# EAGLE design control board (EAGLE 9.7.0)
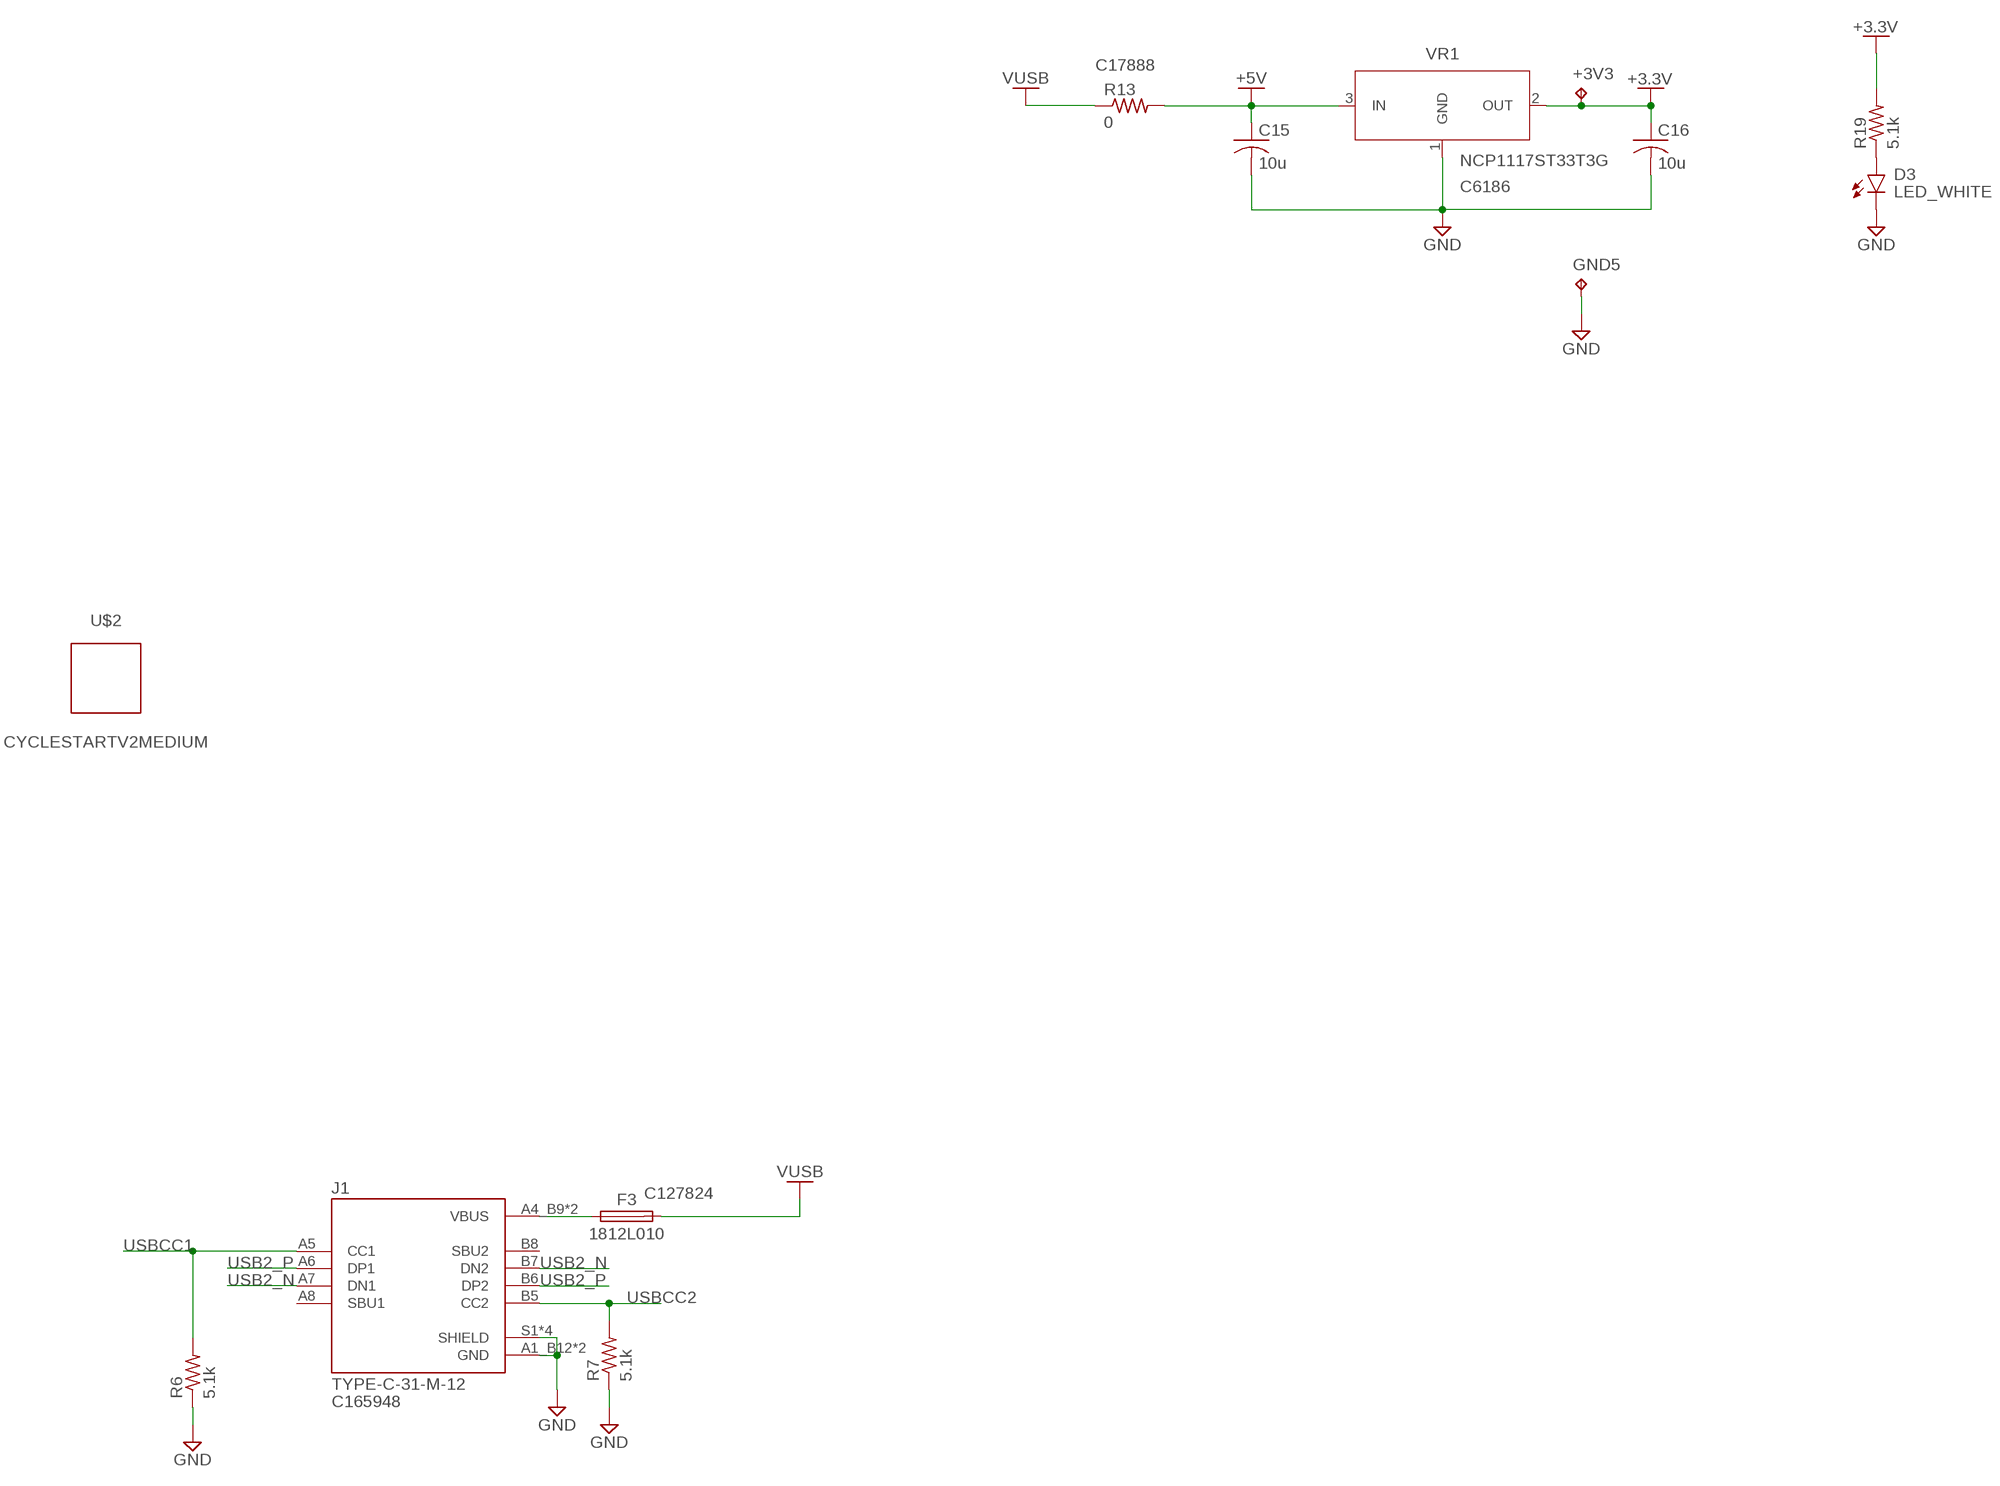
[diagram p0: schematic, sheet 1, part 1 of 2]
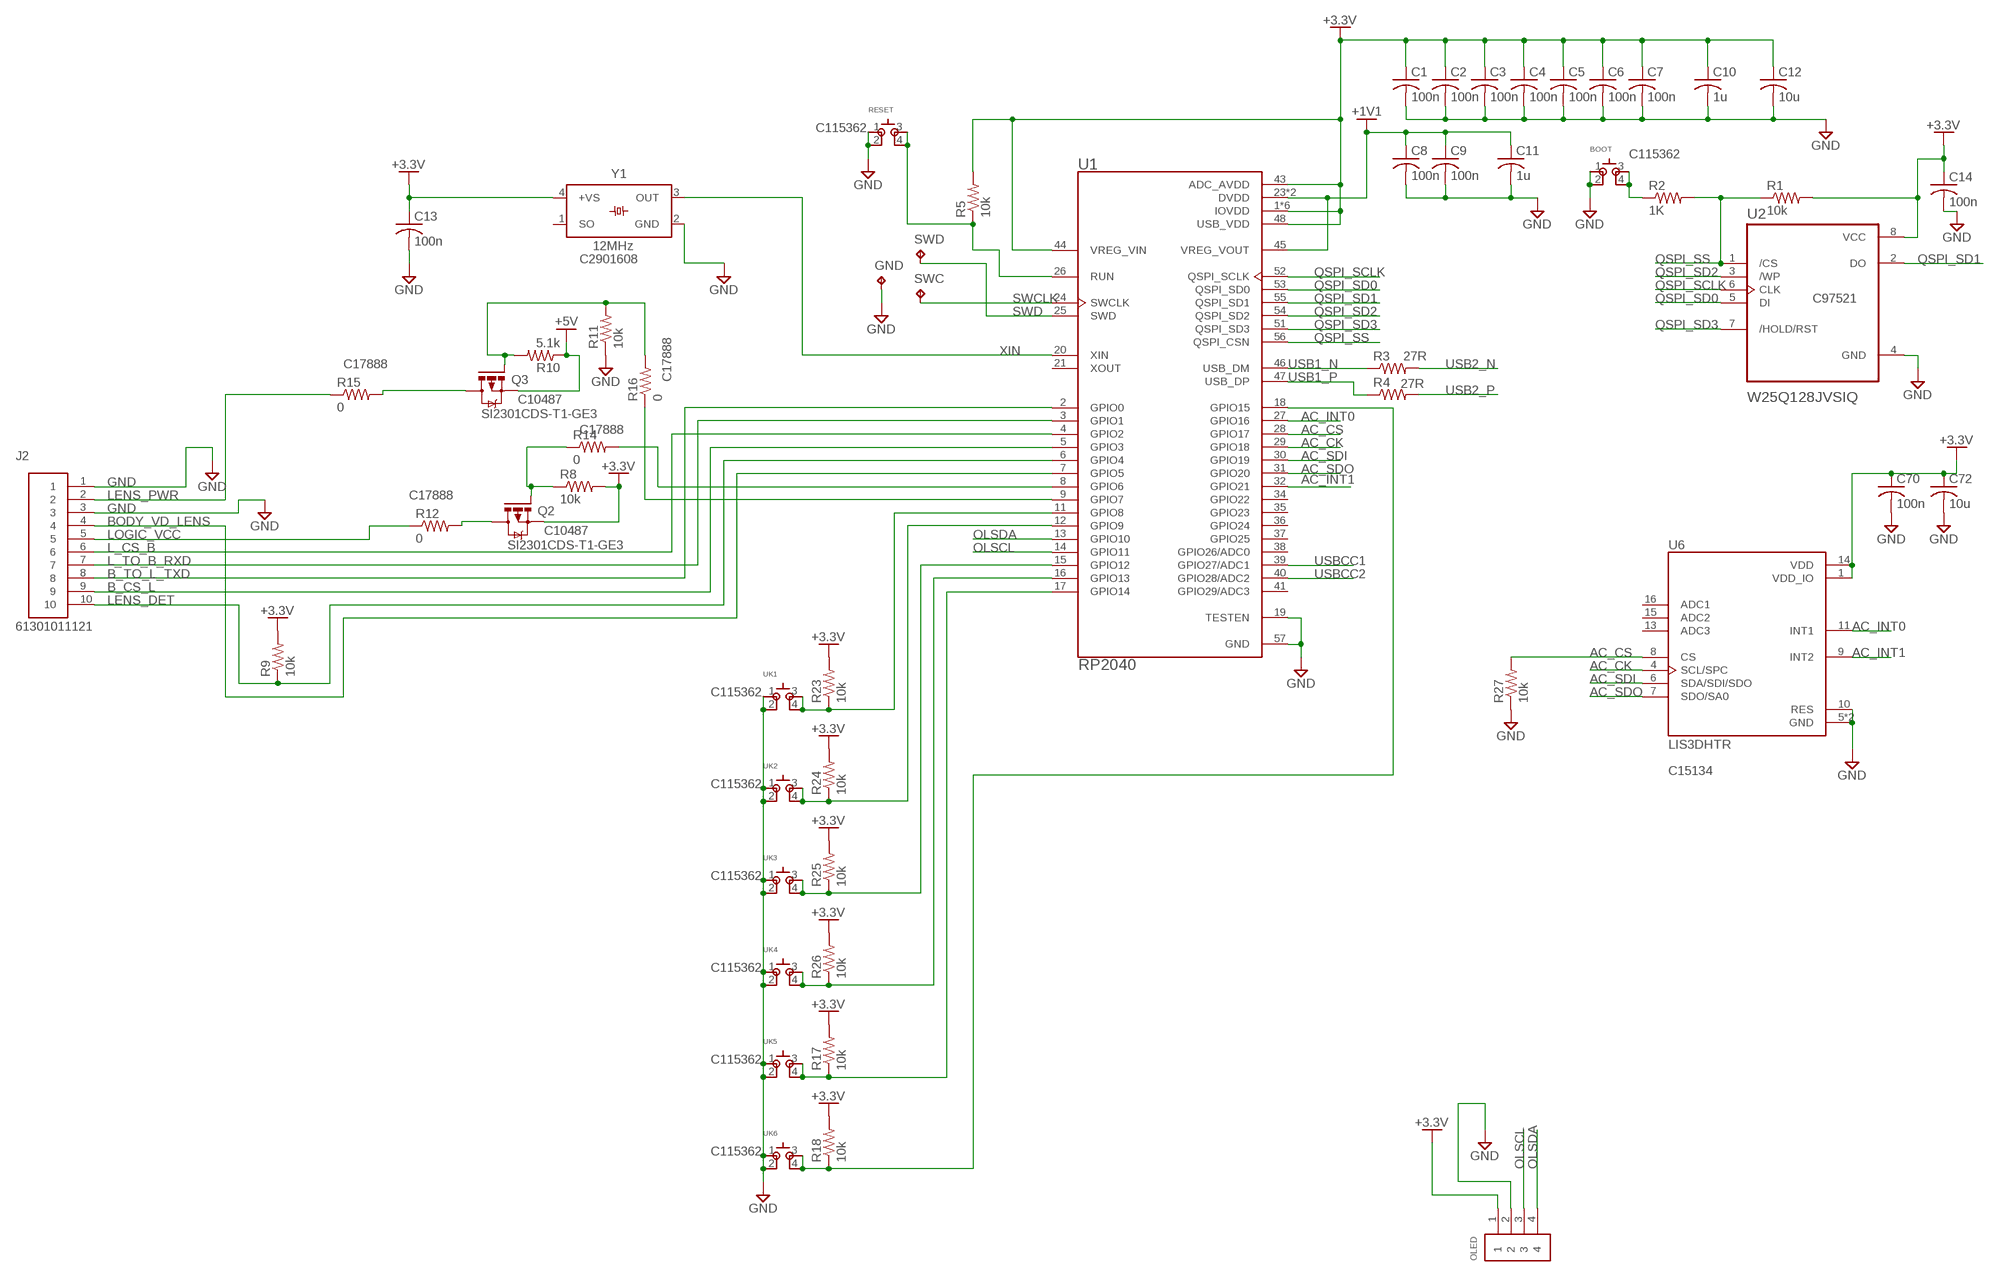
[diagram p1: schematic, sheet 1, part 2 of 2]

## Parts
+3V3  TPB2,54  [B2,54]
BOOT  SKSCLDE010  [SKSCLDE010]
C1  100n  C-USC0603  [C0603]
C2  100n  C-USC0603  [C0603]
C3  100n  C-USC0603  [C0603]
C4  100n  C-USC0603  [C0603]
C5  100n  C-USC0603  [C0603]
C6  100n  C-USC0603  [C0603]
C7  100n  C-USC0603  [C0603]
C8  100n  C-USC0603  [C0603]
C9  100n  C-USC0603  [C0603]
C10  1u  C-USC0603  [C0603]
C11  1u  C-USC0603  [C0603]
C12  10u  C-USC0603  [C0603]
C13  100n  C-USC0603  [C0603]
C14  100n  C-USC0603  [C0603]
C15  10u  C-USC0603  [C0603]
C16  10u  C-USC0603  [C0603]
C70  100n  C-USC0603  [C0603]
C72  10u  C-USC0603  [C0603]
D3  LED_WHITE  CHIP-FLAT-B_0603-0.35MM  [LEDC1608X35N_FLAT-B]
F3  1812L010  [FUSC4532X125]
GND  TPB2,54  [B2,54]
GND5  TPB2,54  [B2,54]
J1  TYPE-C-31-M-12  [HRO_TYPE-C-31-M-12]
J2  61301011121  [61301011121]
OLED  61300411121  [61300411121]
Q2  SI2301CDS-T1-GE3  PMOSFET_IRLML5203_SOT23-GSD  [SOT23]
Q3  SI2301CDS-T1-GE3  PMOSFET_IRLML5203_SOT23-GSD  [SOT23]
R1  10k  R-US_R0603  [R0603]
R2  1K  R-US_R0603  [R0603]
R3  27R  R-US_R0603  [R0603]
R4  27R  R-US_R0603  [R0603]
R5  10k  R-US_R0603  [R0603]
R6  5.1k  R-US_R0603  [R0603]
R7  5.1k  R-US_R0603  [R0603]
R8  10k  R-US_R0603  [R0603]
R9  10k  R-US_R0603  [R0603]
R10  5.1k  R-US_R0603  [R0603]
R11  10k  R-US_R0603  [R0603]
R12  0  R-US_R1206  [R1206]
R13  0  R-US_R1206  [R1206]
R14  0  R-US_R1206  [R1206]
R15  0  R-US_R1206  [R1206]
R16  0  R-US_R1206  [R1206]
R17  10k  R-US_R0603  [R0603]
R18  10k  R-US_R0603  [R0603]
R19  5.1k  R-US_R0603  [R0603]
R23  10k  R-US_R0603  [R0603]
R24  10k  R-US_R0603  [R0603]
R25  10k  R-US_R0603  [R0603]
R26  10k  R-US_R0603  [R0603]
R27  10k  R-US_R0603  [R0603]
RESET  SKSCLDE010  [SKSCLDE010]
SWC  TPB2,54  [B2,54]
SWD  TPB2,54  [B2,54]
U1  RP2040  [QFN40P700X700X90-57N]
U2  W25Q128JVSIQ  W25Q64JVSSIQ  [SOIC127P790X216-8N]
U6  LIS3DHTR  [XDCR_LIS3DHTR]
U$2  CYCLESTARTV2MEDIUM  [CYCLESTARTV2MEDIUM]
UK1  SKSCLDE010  [SKSCLDE010]
UK2  SKSCLDE010  [SKSCLDE010]
UK3  SKSCLDE010  [SKSCLDE010]
UK4  SKSCLDE010  [SKSCLDE010]
UK5  SKSCLDE010  [SKSCLDE010]
UK6  SKSCLDE010  [SKSCLDE010]
VR1  NCP1117ST33T3G  NCP1117ST33T3GSOT-223  [SOT230P700X170-4]
Y1  12MHz  WE-SPXO_IQXO-540_830208214609  [WE-SPXO_IQXO-540]

## Nets
+1V1: C8.1 C9.1 C11.1 U1.23(DVDD) U1.45(VREG_VOUT) U1.50(DVDD)
+3.3V: +3V3.TP C1.1 C2.1 C3.1 C4.1 C5.1 C6.1 C7.1 C10.1 C12.1 C13.1 C14.1 C16.1 C70.1 C72.1 OLED.1 Q2.2(S) R1.2 R5.2 R8.2 R9.2 R17.2 R18.2 R19.2 R23.2 R24.2 R25.2 R26.2 U1.1(IOVDD) U1.10(IOVDD) U1.22(IOVDD) U1.33(IOVDD) U1.42(IOVDD) U1.43(ADC_AVDD) U1.44(VREG_VIN) U1.48(USB_VDD) U1.49(IOVDD) U2.8(VCC) U6.1(VDD_IO) U6.14(VDD) VR1.2(OUT) Y1.4(+VS)
+5V: C15.1 Q3.2(S) R10.1 R13.2 VR1.3(IN)
AC_CK: U1.29(GPIO18) U6.4(SCL/SPC)
AC_CS: R27.2 U1.28(GPIO17) U6.8(CS)
AC_INT0: U1.27(GPIO16) U6.11(INT1)
AC_INT1: U1.32(GPIO21) U6.9(INT2)
AC_SDI: U1.30(GPIO19) U6.6(SDA/SDI/SDO)
AC_SDO: U1.31(GPIO20) U6.7(SDO/SA0)
B_CS_L: J2.9 U1.5(GPIO3)
B_TO_L_TXD: J2.8 U1.2(GPIO0)
BODY_VD_LENS: J2.4 U1.7(GPIO5)
GND: BOOT.1 BOOT.2 C1.2 C2.2 C3.2 C4.2 C5.2 C6.2 C7.2 C8.2 C9.2 C10.2 C11.2 C12.2 C13.2 C14.2 C15.2 C16.2 C70.2 C72.2 D3.C GND5.TP GND.TP J1.A1_B12(GND) J1.B1_A12(GND) J1.S1(SHIELD) J1.S2(SHIELD) J1.S3(SHIELD) J1.S4(SHIELD) J2.1 J2.3 OLED.2 R6.1 R7.1 R11.1 R27.1 RESET.1 RESET.2 U1.19(TESTEN) U1.57(GND) U2.4(GND) U6.5(GND) U6.10(RES) U6.12(GND) UK1.1 UK1.2 UK2.1 UK2.2 UK3.1 UK3.2 UK4.1 UK4.2 UK5.1 UK5.2 UK6.1 UK6.2 VR1.1(GND) Y1.2(GND)
L_CS_B: J2.6 U1.4(GPIO2)
L_TO_B_RXD: J2.7 U1.3(GPIO1)
LENS_DET: J2.10 R9.1 U1.6(GPIO4)
LENS_PWR: J2.2 R15.1
LOGIC_VCC: J2.5 R12.1
N$1: D3.A R19.1
N$2: R14.2 U1.8(GPIO6)
N$3: BOOT.3 BOOT.4 R2.1
N$4: R16.1 U1.9(GPIO7)
N$5: R5.1 RESET.3 RESET.4 U1.26(RUN)
N$6: Q2.3(D) R12.2
N$7: Q2.1(G) R8.1 R14.1
N$8: Q3.3(D) R15.2
N$9: Q3.1(G) R10.2 R11.2 R16.2
N$10: R17.1 U1.17(GPIO14) UK5.3 UK5.4
N$11: R18.1 U1.18(GPIO15) UK6.3 UK6.4
N$17: F3.1 J1.A4_B9(VBUS) J1.B4_A9(VBUS)
N$20: R23.1 U1.11(GPIO8) UK1.3 UK1.4
N$108: R24.1 U1.12(GPIO9) UK2.3 UK2.4
N$109: R25.1 U1.15(GPIO12) UK3.3 UK3.4
N$110: R26.1 U1.16(GPIO13) UK4.3 UK4.4
OLSCL: OLED.3 U1.14(GPIO11)
OLSDA: OLED.4 U1.13(GPIO10)
QSPI_SCLK: U1.52(QSPI_SCLK) U2.6(CLK)
QSPI_SD0: U1.53(QSPI_SD0) U2.5(DI)
QSPI_SD1: U1.55(QSPI_SD1) U2.2(DO)
QSPI_SD2: U1.54(QSPI_SD2) U2.3(/WP)
QSPI_SD3: U1.51(QSPI_SD3) U2.7(/HOLD/RST)
QSPI_SS: R1.1 R2.2 U1.56(QSPI_CSN) U2.1(/CS)
SWCLK: SWC.TP U1.24(SWCLK)
SWD: SWD.TP U1.25(SWD)
USB1_N: R3.1 U1.46(USB_DM)
USB1_P: R4.1 U1.47(USB_DP)
USB2_N: J1.A7(DN1) J1.B7(DN2) R3.2
USB2_P: J1.A6(DP1) J1.B6(DP2) R4.2
USBCC1: J1.A5(CC1) R6.2 U1.39(GPIO27/ADC1)
USBCC2: J1.B5(CC2) R7.2 U1.40(GPIO28/ADC2)
VUSB: F3.2 R13.1
XIN: U1.20(XIN) Y1.3(OUT)
Unconnected: J1.A8(SBU1) J1.B8(SBU2) U1.21(XOUT) U1.34(GPIO22) U1.35(GPIO23) U1.36(GPIO24) U1.37(GPIO25) U1.38(GPIO26/ADC0) U1.41(GPIO29/ADC3) U6.13(ADC3) U6.15(ADC2) U6.16(ADC1) Y1.1(SO)

## Library data of the parts
+3V3 GND GND5 SWC SWD = testpad:TP: Test pad
BOOT RESET UK1-UK6 = alps:SKSCLDE010; JLCPN: C115362
C1-C9 C13 C14 C70 = rcl:C-US: CAPACITOR, American symbol; JLCPN: C14663
C10 C11 = rcl:C-US: CAPACITOR, American symbol; JLCPN: C15849
C12 C15 C16 C72 = rcl:C-US: CAPACITOR, American symbol; JLCPN: C19702
D3 = LED:CHIP-FLAT-B; JLCPN: C2290
F3 = Fuse:1812L: 1812L Series PTC provides surface mount overcurrent protection for applications where resettable protection is desired. Datasheet <https://www.littelfuse.com/~/media/electronics/datasheets/resettable_ptcs/littelfuse_ptc_1812l_datasheet.pdf.pdf>; JLCPN: C127824
J1 = SnapEDA Library:TYPE-C-31-M-12; JLCPN: C165948
J2 = Headers:61301011121: CONN HEADER VERT 10POS 2.54MM Manufacturer's datasheet <https://katalog.we-online.de/em/datasheet/6130xx11121.pdf>
OLED = Headers:61300411121: CONN HEADER VERT 4POS 2.54MM Manufacturer's datasheet <https://katalog.we-online.de/em/datasheet/6130xx11121.pdf>
Q2 Q3 = Transistor:PMOSFET_: P-Channel MOSFET - Popular parts; JLCPN: C10487
R1 R5 R8 R9 R11 R17 R18 R23-R27 = rcl:R-US_: RESISTOR, American symbol; JLCPN: C25804
R2 = rcl:R-US_: RESISTOR, American symbol; JLCPN: C21190
R3 R4 = rcl:R-US_: RESISTOR, American symbol; JLCPN: C2907021
R6 R7 R10 R19 = rcl:R-US_: RESISTOR, American symbol; JLCPN: C23186
R12-R16 = rcl:R-US_: RESISTOR, American symbol; JLCPN: C17888
U1 = SnapEDA Library:RP2040; JLCPN: C2040
U2 = SnapEDA Library:W25Q64JVSSIQ: None; JLCPN: C97521
U6 = LIS3DHTR:LIS3DHTR: MEMS digital output motion sensor ultra low-power high performance 3-axes "nano" accelerometer Check availability <https://pricing.snapeda.com/parts/LIS3DHTR/STMicroelectronics/view-part?ref=eda>; JLCPN: C15134
U$2 = Logos:CYCLESTARTV2
VR1 = IC_Power-Management:NCP1117ST33T3G: 1.0 A Low-Dropout Positive Fixed and Adjustable Voltage Regulators Datasheet <https://www.onsemi.com/pub/Collateral/NCP1117-D.PDF>; JLCPN: C6186
Y1 = Wurth_Quartz Crystals & Oscillators_WE-SPXO:WE-SPXO_IQXO-540: WE-SPXO Simple Packaged Quartz Oscillator Characteristics SMT models Hermetically sealed Frequencies between 3.6864 MHz and 125 MHz Maximum operating temperatures range:-40 °C to 85 °C Stabilities down to ± 25 ppm available Available supply voltages: 1.8 V, 3.3 V and 5 V Available output signal types: CMOS; HCMOS; HCMOS/TTL Applications Microprocessor Wireless Communication Devices Industrial Devices Real Time Clocks Wired Communication (e.g. Ethernet and USB) IoT Optical Network Audio and Multimedia Devices Test and Measurement Equipment Navigation and Locators <https://www.we-online.com/catalog/media/o135918v209%20Family_WE-SPXO.jpg> Details see: https://www.we-online.com/catalog/en/WE-SPXO Updated by Ella Wu, 2019-09-03 2019 (C) Wurth Elektronik; JLCPN: C2901608

## Board
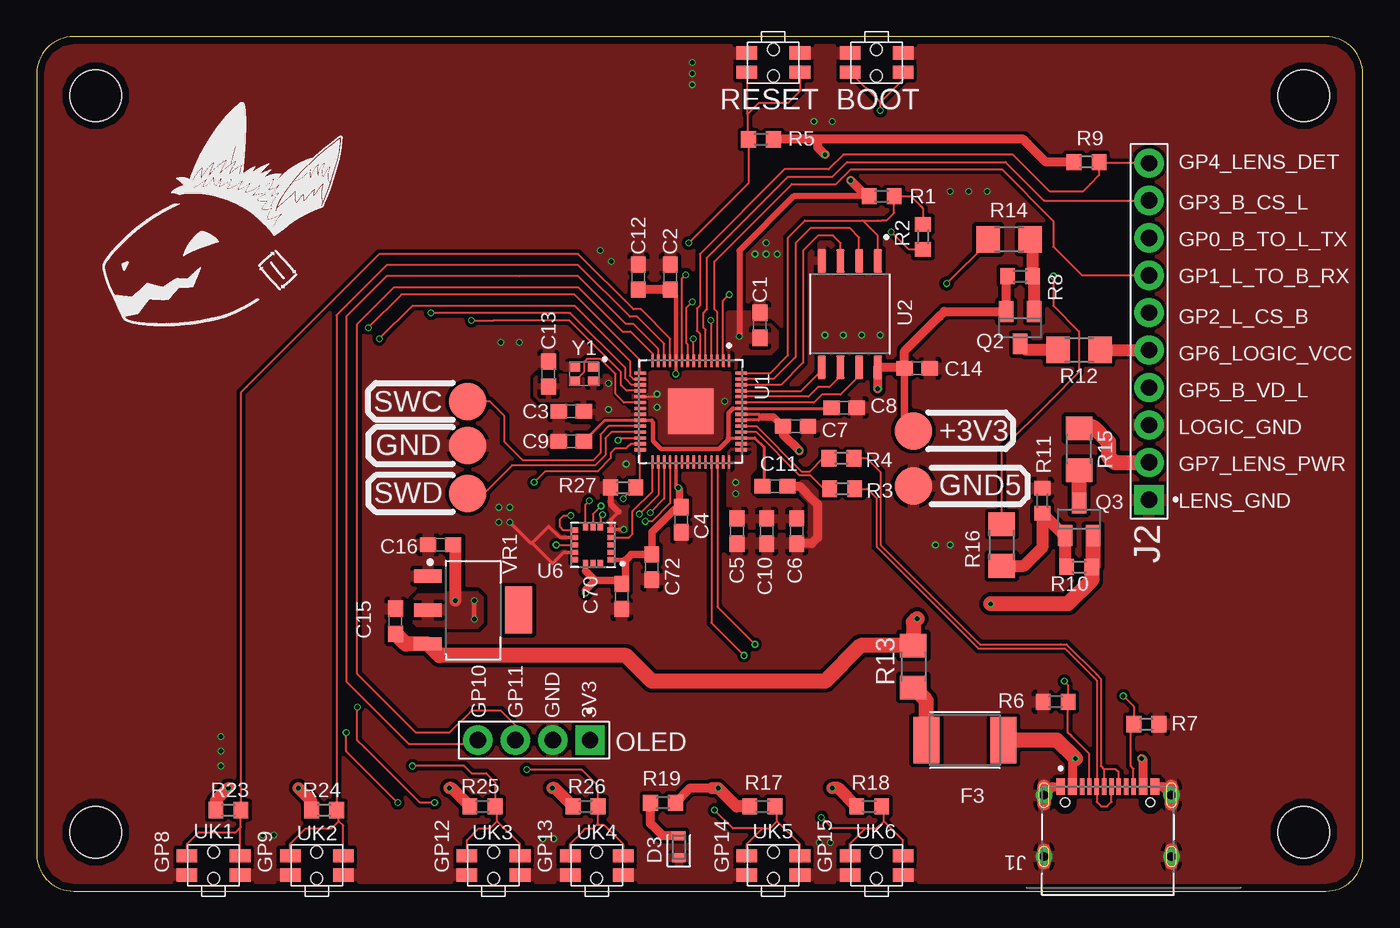
[diagram p2: board, top side]
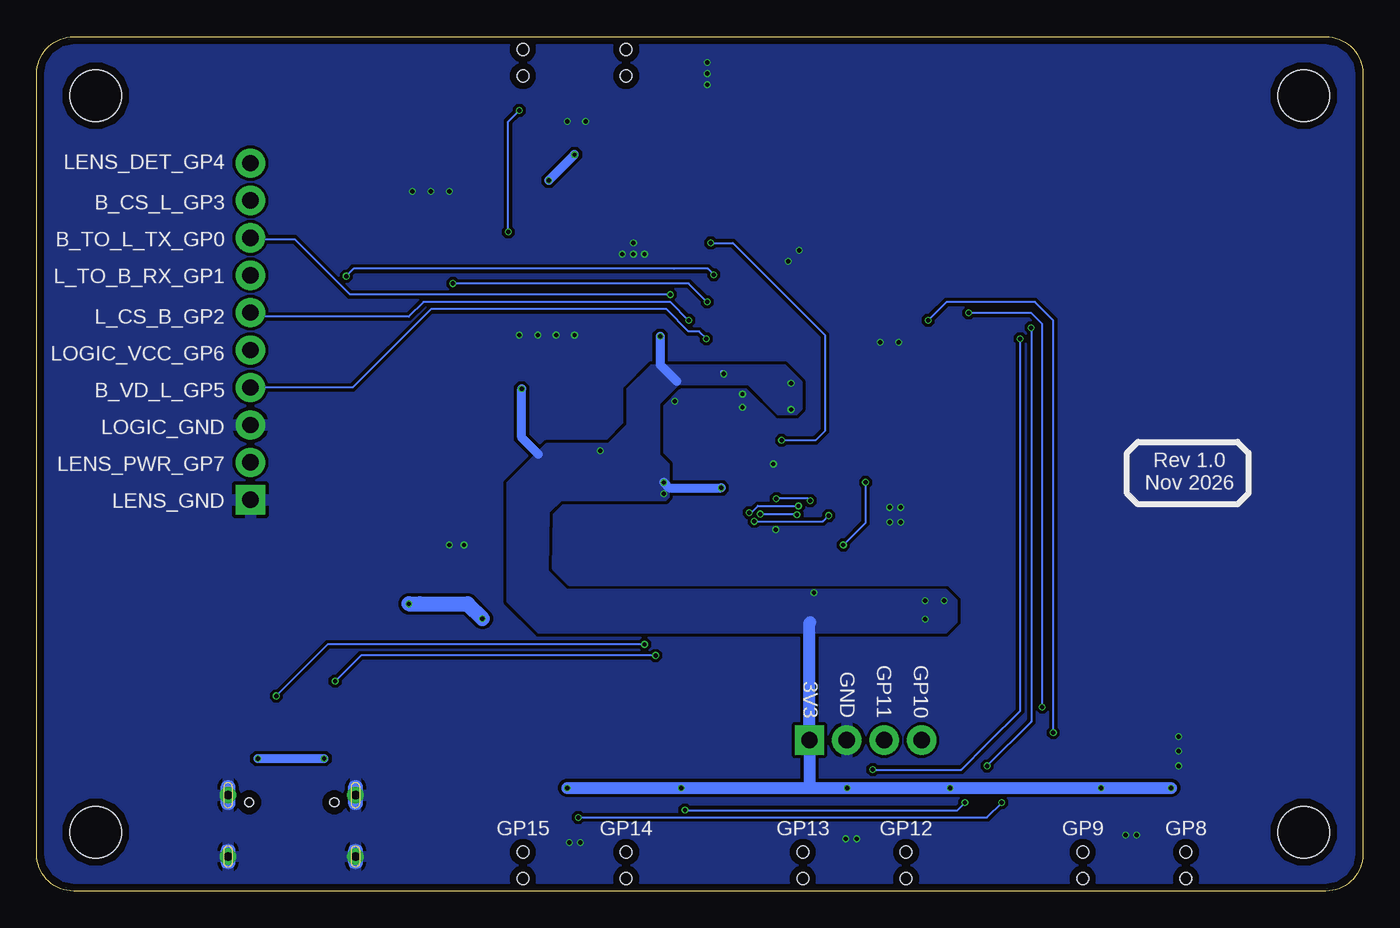
[diagram p3: board, bottom side, seen from below]

Size 90 x 58 mm. Coordinates in mm from the lower left corner, seen from the top.
Outline: 12.5,58 2.5,58 arc90 0,55.5 0,2.5 arc90 2.5,0 87.5,0 arc90 90,2.5 90,55.25 90,55.5 arc90 87.5,58 12.5,58
Copper layers (1*16): Top / Bottom
Stack-up 2 Layer Stack: Top SilkScreen Epoxy Ink / Top SolderMask SR:Black 0.0254mm Dk 4 / Top Surface Finish Lead-Free 0.02mm / Top CuFoil:007 0.035mm / Dielectric-1 Core:080 0.711mm / Bottom CuFoil:007 0.035mm / Bottom Surface Finish Lead-Free 0.02mm / Bottom SolderMask SR:Black 0.0254mm Dk 4 / Bottom SilkScreen Epoxy Ink
Design rules: minimum copper width 5mil, minimum drill size 0.3mm, copper clearance wire_polygon to wire_polygon 5mil, copper clearance wire_polygon to pad_smd 5mil, copper clearance wire_polygon to via 5mil, copper clearance pad_smd to pad_smd 5mil, copper clearance pad_smd to via 5mil, copper clearance via to via 5mil, copper clearance smd to pad (same net) 5mil, copper clearance smd to via (same net) 5mil, copper clearance smd to smd (same net) 5mil, dimension clearance 0.2mm, via restrict clearance 0mil, restrict clearance 0mil, drill distance 6mil, keepout clearance 0mil
Holes 3.5 mm at 4,4 86,4 86,54 4,54

### Footprints (pad centres in the part's own frame; a part is rotated, then mirrored left to right if it is on the bottom)
B2,54 = smd 2.54 x 2.54: TP 0,0
SKSCLDE010 = smd 1.4 x 0.9: 1 -1.8,-0.65; 2 1.8,-0.65; 3 -1.8,0.65; 4 1.8,0.65 | hole 0.8: 0,0.9; 0,-0.9
C0603 = smd 1.1 x 1: 1 -0.85,0; 2 0.85,0
LEDC1608X35N_FLAT-B = smd 0.612 x 0.912: A 0.75,0; C -0.75,0
FUSC4532X125 = smd 1.78 x 3.15: 1 -2.615,0; 2 2.615,0
HRO_TYPE-C-31-M-12 = smd 0.6 x 1.14: A1_B12 -3.2,4.75; A4_B9 -2.4,4.75; B1_A12 3.2,4.75; B4_A9 2.4,4.75 | smd 0.3 x 1.14: A5 -1.25,4.75; A6 -0.25,4.75; A7 0.25,4.75; A8 1.25,4.75; B5 1.75,4.75; B6 0.75,4.75; B7 -0.75,4.75; B8 -1.75,4.75 | drill 0.6 pad 0.9: S1 -4.325,4.17; S2 4.325,4.17; S3 -4.325,0; S4 4.325,0 | hole 0.6: -2.89,3.68; 2.89,3.68
61301011121 = drill 1.1 square: 1 -11.43,0 | drill 1.1: 2 -8.89,0; 3 -6.35,0; 4 -3.81,0; 5 -1.27,0; 6 1.27,0; 7 3.81,0; 8 6.35,0; 9 8.89,0; 10 11.43,0
61300411121 = drill 1.1 square: 1 -3.81,0 | drill 1.1: 2 -1.27,0; 3 1.27,0; 4 3.81,0
SOT23 = smd 1 x 1.4: 1 -0.95,-1.1; 2 0.95,-1.1; 3 0,1.1
R0603 = smd 1 x 1.1: 1 -0.85,0; 2 0.85,0
R1206 = smd 1.6 x 1.803: 1 -1.422,0; 2 1.422,0
QFN40P700X700X90-57N = smd 0.84 x 0.2: 1 -3.435,2.6; 2 -3.435,2.2; 3 -3.435,1.8; 4 -3.435,1.4; 5 -3.435,1; 6 -3.435,0.6; 7 -3.435,0.2; 8 -3.435,-0.2; 9 -3.435,-0.6; 10 -3.435,-1; 11 -3.435,-1.4; 12 -3.435,-1.8; 13 -3.435,-2.2; 14 -3.435,-2.6; 29 3.435,-2.6; 30 3.435,-2.2; 31 3.435,-1.8; 32 3.435,-1.4; 33 3.435,-1; 34 3.435,-0.6; 35 3.435,-0.2; 36 3.435,0.2; 37 3.435,0.6; 38 3.435,1; 39 3.435,1.4; 40 3.435,1.8; 41 3.435,2.2; 42 3.435,2.6 | smd 0.2 x 0.84: 15 -2.6,-3.435; 16 -2.2,-3.435; 17 -1.8,-3.435; 18 -1.4,-3.435; 19 -1,-3.435; 20 -0.6,-3.435; 21 -0.2,-3.435; 22 0.2,-3.435; 23 0.6,-3.435; 24 1,-3.435; 25 1.4,-3.435; 26 1.8,-3.435; 27 2.2,-3.435; 28 2.6,-3.435; 43 2.6,3.435; 44 2.2,3.435; 45 1.8,3.435; 46 1.4,3.435; 47 1,3.435; 48 0.6,3.435; 49 0.2,3.435; 50 -0.2,3.435; 51 -0.6,3.435; 52 -1,3.435; 53 -1.4,3.435; 54 -1.8,3.435; 55 -2.2,3.435; 56 -2.6,3.435 | smd 3.1 x 3.1: 57 0,0
SOIC127P790X216-8N = smd 1.61 x 0.58: 1 -3.605,1.905; 2 -3.605,0.635; 3 -3.605,-0.635; 4 -3.605,-1.905; 5 3.605,-1.905; 6 3.605,-0.635; 7 3.605,0.635; 8 3.605,1.905
XDCR_LIS3DHTR = smd 0.45 x 0.35: 1 -1.225,1; 2 -1.225,0.5; 3 -1.225,0; 4 -1.225,-0.5; 5 -1.225,-1; 9 1.225,-1; 10 1.225,-0.5; 11 1.225,0; 12 1.225,0.5; 13 1.225,1 | smd 0.35 x 0.45: 6 -0.5,-1.225; 7 0,-1.225; 8 0.5,-1.225; 14 0.5,1.225; 15 0,1.225; 16 -0.5,1.225
SOT230P700X170-4 = smd 1.86 x 0.898: 1 -3.075,2.3; 2 -3.075,0; 3 -3.075,-2.3 | smd 1.86 x 3.189: 4 3.075,0
WE-SPXO_IQXO-540 = smd 0.75 x 0.65: 1 -0.65,-0.5; 2 0.65,-0.5; 3 0.65,0.5; 4 -0.65,0.5

### Placement (x,y rotation side)
+3V3  59.5,31.25 0 top
BOOT  57,56.25 180 top
C1  49.09,38.41 90 top
C2  42.99,41.69 90 top
C3  36.27,32.57 180 top
C4  43.75,25.22 270 top
C5  47.52,24.44 270 top
C6  51.58,24.44 270 top
C7  51.5,31.55 0 top
C8  54.8,32.82 0 top
C9  36.27,30.54 180 top
C10  49.55,24.44 270 top
C11  50.11,27.49 0 top
C12  40.84,41.69 90 top
C13  34.74,35.11 90 top
C14  59.76,35.49 0 top
C15  24.36,18.32 90 top
C16  27.4,23.52 180 top
C70  39.7,20 270 top
C72  41.75,22 270 top
D3  43.58,3 90 top
F3  63,10.25 180 top
GND  29.25,30.25 0 top
GND5  59.5,27.5 0 top
J1  72.69,2.35 0 top
J2  75.5,38 90 top
OLED  33.75,10.25 180 top
Q2  66.75,38.25 180 top
Q3  70.75,25.25 0 top
R1  57.34,47.17 180 top
R2  60.15,44.41 90 top
R3  54.67,27.31 0 top
R4  54.62,29.39 0 top
R5  49.16,51.04 0 top
R6  69.15,12.85 0 top
R7  75.32,11.33 180 top
R8  66.75,41.75 180 top
R9  71.25,49.5 180 top
R10  70.75,22 180 top
R11  68.25,26.5 270 top
R12  70.75,36.75 180 top
R13  59.5,15.25 90 top
R14  66,44.25 180 top
R15  70.75,30 270 top
R16  65.5,23.5 270 top
R17  49.25,5.75 180 top
R18  56.5,5.75 180 top
R19  42.5,6 0 top
R23  13,5.5 180 top
R24  19.5,5.5 180 top
R25  30.25,5.75 180 top
R26  37.25,5.75 180 top
R27  39.8,27.4 0 top
RESET  50,56.25 180 top
SWC  29.25,33.25 0 top
SWD  29.25,27 0 top
U1  44.39,32.57 270 top
U2  55.19,39.17 270 top
U6  37.75,23.5 180 top
U$2  13.5,45.75 0 top
UK1  12,1.75 0 top
UK2  19,1.75 0 top
UK3  31,1.75 0 top
UK4  38,1.75 0 top
UK5  50,1.75 0 top
UK6  57,1.75 0 top
VR1  29.62,19.08 0 top
Y1  37.15,35.11 180 top

### Tracks (layer width: path | path; a pad name or v marks a point on that pad's centre or on a via)
+1V1
  Top 0.203: C8.1 53.9,32.77 U1.50 47.26,32.77 | C9.1 38.56,31.97 U1.23 41.69,31.97 41.72,31.93 | C11.1 49.34,27.58 49.34,30.16 48.73,30.77 U1.45 46.95,30.77 46.91,30.77
  Top 0.305: 41.72,31.93 41.83,31.83 41.83,30.56 42.38,30.01 46.3,30.01 46.95,30.66 46.95,30.77 | 47.26,32.77 46.95,32.47 46.95,30.81 46.91,30.77
+3.3V  (via drill 0.3)
  Top 0.203: U1.49 49.04,32.37 49.22,32.19 49,31.97 U1.48 | 43.64,26.18 C4.1 | 43.39,40.44 C2.1 | U1.44 U1.43 | v43.38,35.11 43.39,35.12
  Top 0.254: U1.33 43.39,28.12 43.39,27.37 v43.55,27.37 | 43.39,35.12 U1.10
  Top 0.305: U1.10 43.39,40.44 | C4.1 43.45,26.07 | U6.1 39.95,22.5 40,22.5 | 40.25,22.75 40.35,22.85 | 39.45,21.1 C70.1 39.95,21.1 | U6.14 37.25,21.75 | v29.69,19.71 v29.69,18.46
  Top 0.406: R1.2 51.38,47.17 47.69,43.48 v47.69,37.67
  Top 0.508: v43.55,27.37 43.64,27.28 43.64,26.18 | 49.22,32.19 50.02,32.19 C7.1 | 43.45,26.07 41.75,24.37 C72.1 40.35,22.85 | 40.25,22.75 40,22.5 | 37.25,21.75 37.9,21.1 | 39.45,21.1 37.9,21.1 | 39.95,22.5 39.95,21.1 | 37.9,21.1 37.25,20.45 v37.25,20.25 | C14.1 58.91,31.84 +3V3.TP
  Top 0.61: C2.1 C12.1 | C7.1 50.65,31.01 v51.76,29.9 | v57.09,34.09 U2.8 58.83,35.57 C14.1 58.91,36.66 61.25,39 61.6,39.35 Q2.2 65.8,41.65 R8.2 | 56.65,47.33 R1.2 56.33,47.17 v55.25,48.25 | R9.2 68.5,49.5 67.25,50.75 66.96,51.04 53,51.04 | 53,51.04 R5.2 | 53,51.04 53,50.5 v53.5,50 | R19.2 44.35,7 45.85,7
  Top 0.813: C16.1 28.42,23.36 v28.42,19.71 | R18.2 54.4,7 v54,7 | v13,7 12.15,6.15 R23.2 | R24.2 18.65,6.1 v17.75,7 | R25.2 28.15,7 v28,7 | R26.2 35.15,7 v35,7 | 45.85,7 v46.25,7 47.5,5.75 R17.2
  Bottom 0.305: 43.5,35.24 v43.38,35.11
  Bottom 0.61: 55.95,29.65 57.09,30.79 v57.09,34.09 | v47.69,37.67 47.69,35.74 46.55,34.6 | v47.44,27.74 47.07,27.37 v43.55,27.37 | v53.5,50 v55.25,48.25
  Bottom 0.813: v54,7 v46.25,7 37.5,7 | 37.5,7 v35,7 v28,7 v17.75,7 v13,7 | 37.5,7 37.56,7.06 OLED.1 37.56,18.19 37.5,18.25
  other vias: 38.8,34.47 47.44,26.98 38.8,32.7
  pour Top (isolate 0.152): 51.63,26.67 52.09,26.21 52.09,24.57 47.44,24.57 46.8,25.2 46.8,29.77 47.19,30.16 47.19,30.54 47.31,30.66 48.45,30.66 48.84,30.28 48.84,28.63 48.45,28.25 48.45,27.08 48.86,26.67
  pour Top (rank 2): 49.85,38.53 50.35,38.03 50.35,36.88 49.85,36.38 47.95,36.38 47.57,36 47.57,35.49 47.44,35.36 46.8,35.36 46.68,35.49 46.68,39.17 46.93,39.43 48.71,39.43 49.09,39.05 49.09,38.54 49.09,38.53
  pour Bottom (isolate 0.254): 58.11,19.61 58.11,27.74 55.44,30.41 51.25,30.41 49.98,31.68 49.98,34.09 48.33,35.74 39.18,35.74 38.04,34.6 38.04,32.7 38.42,32.31 39.69,32.31 41.72,34.35 46.42,34.35 47.69,33.08 47.69,29.65 47.06,29.01 47.06,26.73 47.31,26.47 54.42,26.47 55.19,25.71 55.25,21.75 54,20.5 28.25,20.5 27.5,19.75 27.5,18.25 28.26,17.49 55.98,17.49
  pour Top: 38.8,35.11 33.98,35.11 33.72,34.85 33.72,33.59 34.1,33.2 36.27,33.2 36.27,32.06 36.4,31.93 39.05,31.93 39.18,32.06 41.34,32.06 41.47,32.19 41.47,32.57 41.34,32.7 40.2,32.7 39.18,33.71 39.18,34.73
  pour Top: 30.32,18.19 30.32,19.97 29.94,20.35 27.91,20.35 27.79,20.22 25.88,20.22 25.5,19.84 25.5,18.19 25.75,17.94 27.79,17.94 27.91,17.81 29.94,17.81
+5V  (via drill 0.3)
  Top 0.61: 71.7,22.1 R10.1
  Top 1.016: Q3.2 71.7,22.1 | R10.1 71.6,21.1 70,19.5 65.5,19.5 v64.75,19.5 | v59.75,18.5 59.5,18.25 R13.2 55.92,16.67 53.5,14.25 41.75,14.25 40,16 27.33,16 VR1.3 25.04,16.78 C15.1
  Bottom 1.016: v64.75,19.5 64,19.5 60.75,19.5 v59.75,18.5
AC_CK
  Top 0.152: U6.4 40.2,24 40.45,24.25 40.45,25.8 41.79,27.14 U1.29
AC_CS  (via drill 0.3)
  Top 0.152: U6.8 37.25,26.25 v37.5,26.5 | v39.8,26.65 40.55,27.4 R27.2 40.96,27.71 U1.28
  Bottom 0.152: v37.5,26.5 37.65,26.65 v39.8,26.65
AC_INT0  (via drill 0.3)
  Top 0.152: U1.27 40.32,30.37 40.05,30.1 40,30.05 39.25,30.05 38.95,29.75 38.95,29.5 38.95,29.4 38.05,28.5 34.5,28.5 v33.75,27.75 | v35.25,23.5 U6.11
  Bottom 0.152: v33.75,27.75 33.75,25 v35.25,23.5
AC_INT1  (via drill 0.3)
  Top 0.152: U1.32 42.99,26.34 41.75,25.1 v41.3,25.1 | U6.9 35.75,24.5 35.5,24.75 35.5,25.25 35.75,25.5 v36.25,25.5
  Bottom 0.152: v41.3,25.1 36.65,25.1 v36.25,25.5
AC_SDI  (via drill 0.3)
  Top 0.152: U1.30 42.19,26.89 v40.9,25.6 | v38.4,25.55 38.25,25.4 U6.6
  Bottom 0.152: v40.9,25.6 38.45,25.6 v38.4,25.55
AC_SDO  (via drill 0.3)
  Top 0.152: U1.31 42.59,26.64 v41.65,25.7 | v38.3,26.15 37.75,25.6 U6.7
  Bottom 0.152: v41.65,25.7 41.5,25.7 41.05,26.15 v38.3,26.15
B_CS_L
  Top 0.152: U1.5 45.39,38.11 45.25,38.25 45.25,39.25 45.5,39.5 45.5,43 51,48.5 54,48.5 55,49.5 65.75,49.5 68.36,46.89 J2.9
B_TO_L_TXD  (via drill 0.3)
  Top 0.152: U1.2 46.59,40.09 v47,40.5
  Bottom 0.152: J2.8 75.4,44.25 72.75,44.25 72.5,44.25 68.75,40.5 v47,40.5
BODY_VD_LENS  (via drill 0.3)
  Top 0.152: U1.7 44.59,37.46 v44.55,37.5
  Bottom 0.152: v44.55,37.5 45.05,38 45.75,38 47.25,39.5 63.25,39.5 64.5,38.25 68.56,34.19 J2.4
GND  (via drill 0.3)
  Top 0.152: U1.19 41.92,33.57 v42.1,33.75
  Top 0.254: 39.5,25.75 38.98,25.23 U6.5 39.02,24.55 v39.85,24.55 | U6.10 35.5,24 34.75,24.75 33.62,23.62 | 33.62,23.62 35,22.25 35.75,23 U6.12 | 33.62,23.62 33.52,23.62 v32.1,25.05
  Top 0.406: R27.1 38.95,26.3 39.5,25.75
  Top 0.61: J1.S2 76.44,7.1 J1.B1_A12 | J1.S1 68.95,7.1 J1.A1_B12 | C11.2 51.76,27.49 52.75,26.5 53,26.25 53,24 52.59,23.59 C6.2
  other vias: 49.5,43.25 50.25,43.25 48.75,43.25 49.5,44 42.1,32.85 46.7,33.25 53.5,37.75 54.75,37.75 56,37.75 57.25,37.75 62,47.5 63.25,47.5 64.5,47.5 40,29 31.35,25.05 31.35,26.05 32.1,26.05 15.35,3.8 16.1,3.8 34.35,3.55 35.1,3.55 53.85,3.3 53.1,3.3 44.5,56.25 44.5,55.5 44.5,54.75 12.5,8.5 12.5,9.5 12.5,10.5 61,23.5 62,23.5 52.75,52.25 54,52.25 39,42.75 38.25,43.5 32.75,37.25 31.5,37.25
  pour Top (isolate 0.152, rank 2, no thermals): 47.06,35.24 47.06,30.54 46.3,29.77 41.72,29.77 41.47,30.03 41.47,33.08 41.22,33.33 40.45,33.33 40.45,33.84 41.34,33.84 41.6,34.09 41.6,35.24
  pour Top (isolate 0.254, rank 6): 92.86,60.25 -3.75,60.25 -3.75,-3 92.96,-3 92.96,44.29
  pour Bottom (isolate 0.2, rank 6): -1.75,59 91,59 91,-1.5 -1.38,-1.5 -1.38,17.12
L_CS_B  (via drill 0.3)
  Top 0.152: U1.4 45.79,38.71 v45.75,38.75
  Bottom 0.152: v45.75,38.75 47,40 63.75,40 64.75,39 75.48,39 J2.6
L_TO_B_RXD
  Top 0.152: U1.3 46.19,39.31 46,39.5 46,42.75 46.19,42.94 51.25,48 54.25,48 55.25,49 65.5,49 69,45.5 69,43.75 70.94,41.81 J2.7
LENS_DET
  Top 0.152: J2.10 72.17,49.43 R9.1 72.1,48.6 71.5,48 71,47.5 68.75,47.5 66.25,50 54.75,50 53.75,49 50.75,49 45,43.25 45,39.75 44.8,39.55 44.8,38.05 45,37.85 45,36.01 U1.6
LENS_PWR
  Top 0.813: 70.83,31.5 R15.1
  Top 1.016: 70.83,31.5 71.75,31.5 72.75,30.5 72.75,29.5 73.14,29.11 J2.2
LOGIC_VCC
  Top 0.813: 72.44,36.48 R12.1 75.48,36.75 J2.5
N$1
  Top 0.61: D3.A 42.49,3.75 41.75,4.5 41.65,4.6 R19.1
N$2  (via drill 0.3)
  Top 0.152: U1.8 44.19,37.11 44.1,37.2 44.1,39.6 v44.5,40 | v61.75,41.25 64.58,44.08 R14.2
  Bottom 0.152: v44.5,40 45.75,41.25 v61.75,41.25
N$3  (via drill 0.3)
  Top 0.152: R2.1 59.19,43.56 v58,44.75 | v57.25,53 57.25,53.55 | BOOT.3 58.8,55.1 57.25,53.55 | BOOT.4 57.25,53.55
  Bottom 0.152: v58,44.75 58,52.25 v57.25,53
N$4  (via drill 0.3)
  Top 0.152: U1.9 43.79,41.59 v44.05,41.85 | v69,41.75 69,39.75 70.75,38 70.75,35.25 68.75,33.25 65.5,30 R16.1
  Bottom 0.152: v44.05,41.85 44.45,42.25 46.75,42.25 68.5,42.25 v69,41.75
N$5  (via drill 0.3)
  Top 0.152: RESET.3 51.8,54.3 51,53.5 49,53.5 48.25,52.75 | 48.25,52.75 48.25,51.09 R5.1 48.3,48.05 v44.25,44 | RESET.4 48.2,52.8 48.25,52.75 | v39.45,30.6 39.62,30.77 U1.26
  Bottom 0.152: v44.25,44 42.75,44 36.5,37.75 36.5,31.25 37.15,30.6 v39.45,30.6
N$6
  Top 0.813: R12.2 67.15,36.75 Q2.3
N$7
  Top 0.813: Q2.1 67.7,41.65 R8.1 67.6,44.07 R14.1
N$8
  Top 1.016: R15.2 Q3.3
N$9
  Top 0.813: R16.2 67,22.08 68.25,23.33 R11.2 69.75,24.15 Q3.1 69.8,22.1 R10.2
N$10  (via drill 0.3)
  Top 0.152: UK5.3 48.2,3.2 49.25,4.25 | 49.25,4.25 49.75,4.25 50.25,4.75 | 50.25,4.75 50.25,5.6 R17.1 | UK5.4 51.8,3.2 50.25,4.75 | U1.17 40.38,34.37 40,34.75 39.95,34.8 39.95,35.5 36.2,39.25 31,39.25 v26.75,39.25 | 49.25,4.25 47.25,4.25 v46,5.5 | v27,6 26,6 22.25,9.75 21.75,10.25 v21.75,12.5
  Bottom 0.152: v46,5.5 27.5,5.5 v27,6 | v21.75,12.5 21.75,38.5 22.5,39.25 v26.75,39.25
N$11  (via drill 0.3)
  Top 0.152: UK6.3 55.2,3.2 56.25,4.25 | 56.25,4.25 57,4.25 57.5,4.75 | 57.5,4.75 57.5,5.6 R18.1 | UK6.4 58.8,3.45 57.5,4.75 | U1.18 40.03,33.97 39.65,34.35 39.65,35.25 36.15,38.75 31,38.75 v29.5,38.75 | 56.25,4.25 54,4.25 v53.25,5 | v24.5,6 21,9.5 v21,10.75
  Bottom 0.152: v53.25,5 27.5,5 25.5,5 v24.5,6 | v21,10.75 21,38.75 22.25,40 28.25,40 v29.5,38.75
N$17  (via drill 0.3)
  Top 0.61: J1.B4_A9 75.09,8.9 v75,9 | v70.5,9 70.3,8.79 J1.A4_B9
  Top 1.016: v70.5,9 69.25,10.25 F3.1
  Bottom 0.61: v75,9 v70.5,9
N$20
  Top 0.152: UK1.3 10.2,3.2 11,4 13.5,4 13.85,4.35 | 13.85,4.35 R23.1 13.85,33.85 14.25,34.25 23.25,43.25 36.75,43.25 40.5,39.5 41,39.5 42.99,37.51 U1.11 | UK1.4 13.8,4.3 13.85,4.35
N$108
  Top 0.152: UK2.3 17.2,3.2 18.25,4.25 20,4.25 20.5,4.75 | 20.5,4.75 20.5,5.35 R24.1 20.35,39.1 21,39.75 23.75,42.5 36.75,42.5 40.25,39 40.75,39 42.59,37.16 U1.12 | UK2.4 20.8,4.45 20.5,4.75
N$109  (via drill 0.3)
  Top 0.152: UK3.3 29.2,3.45 30,4.25 30.75,4.25 31.25,4.75 | 31.25,4.75 31.25,5.6 R25.1 31.1,7.4 31,7.5 30.5,8 29.5,8 29,8.5 v25.5,8.5 | UK3.4 32.8,3.2 31.25,4.75 | U1.15 40.96,36.04 39.5,37.5 36.5,40.5 24.75,40.5 v22.5,38.25
  Bottom 0.152: v22.5,38.25 22.5,11.5 v25.5,8.5
N$110  (via drill 0.3)
  Top 0.152: UK4.3 36.2,3.2 37,4 37.25,4.25 37.75,4.25 38,4.5 | 38,4.5 38.1,4.6 R26.1 38.1,7.15 37,8.25 v33.25,8.25 | 38,4.5 38.5,4.5 39.75,3.25 39.8,3.2 UK4.4 | v23.25,37.5 25.5,39.75 36,39.75 36.5,39.75 40.25,36 40.25,35 40.5,34.75 40.94,34.75 U1.16
  Bottom 0.152: v33.25,8.25 27.25,8.25 25.5,10 23.25,12.25 v23.25,37.5
OLSCL
  Top 0.152: OLED.3 32.48,11.27 31.5,12.25 29.5,12.25 28,10.75 25.75,10.75 21.75,14.75 21.75,38.5 24.25,41 36.75,41 39.75,38 40.3,38 41.79,36.5 U1.14
OLSDA
  Top 0.152: U1.13 42.19,36.81 40.5,38.5 40,38.5 36.75,41.75 32.75,41.75 23.75,41.75 21,39 21,14.25 25.25,10 29.69,10 OLED.4
QSPI_SCLK
  Top 0.152: U2.6 54.55,34.98 53.79,34.22 53.03,34.22 52.38,33.57 U1.52
QSPI_SD0
  Top 0.152: U1.53 51.88,33.97 52.52,34.6 53.28,35.36 U2.5
QSPI_SD1
  Top 0.152: U2.2 55.82,44.38 55.19,45.02 52.52,45.02 51.5,44 51.5,36.25 50.02,34.77 U1.55
QSPI_SD2
  Top 0.152: U2.3 54.55,44 54.04,44.51 53.03,44.51 52.01,43.49 52.01,35.87 50.51,34.37 U1.54
QSPI_SD3
  Top 0.152: U2.7 55.82,34.98 54.55,33.71 53.28,33.71 52.74,33.17 U1.51
QSPI_SS
  Top 0.152: 56.08,45.52 52.14,45.52 50.99,44.38 50.99,36.89 50.99,36.38 49.78,35.17 U1.56 | 56.08,45.52 57.09,45.52 57.34,45.52 57.69,45.52 58.2,46.03 R1.1 59.33,47.17 60,46.5 60.15,46.35 R2.2 | U2.1 57.09,44.51 56.08,45.52
SWCLK
  Top 0.152: U1.24 38.82,31.57 38.25,31 38.25,29.75 37.75,29.25 33,29.25 31.75,30.5 31.75,32.25 30.75,33.25 SWC.TP
SWD
  Top 0.152: U1.25 39.02,31.17 38.6,30.75 38.6,29.6 37.9,28.9 32.25,28.9 30.35,27 SWD.TP
USB1_N
  Top 0.152: U1.46 48.84,31.17 51.78,28.23 52.51,28.23 53.42,27.31 R3.1
USB1_P
  Top 0.152: U1.47 48.83,31.57 51.9,28.5 52.48,28.5 53.37,29.39 R4.1
USB2_N
  Top 0.152: R3.2 56.38,27.31 57,26.69 57,23.5 57,23.38 63.91,16.47 69.5,16.47 69.78,16.47 71.75,14.5 71.94,14.3 J1.B7 71.94,6.05 72.25,5.75 72.65,5.75 72.94,6.04 J1.A7
USB2_P
  Top 0.152: R4.2 56.33,29.39 57.28,28.44 57.28,23.5 64.03,16.75 69.5,16.75 69.89,16.75 71.95,14.7 72.22,14.42 72.22,8.5 72.44,8.28 | 72.44,8.28 J1.A6 | J1.B6 73.44,8.05 73.25,8.25 73.22,8.28 72.44,8.28
USBCC1  (via drill 0.3)
  Top 0.152: J1.A5 71.44,9.3 70.25,10.5 70,10.75 70,12.75 | 70,12.75 R6.2 | U1.39 45.79,18.21 v48,16 | v69.75,14.25 70,14 70,12.75
  Bottom 0.152: v48,16 68,16 v69.75,14.25
USBCC2  (via drill 0.3)
  Top 0.152: J1.B5 74.44,8.3 74.25,8.5 74.25,11.12 R7.2 74.47,12.53 v73.75,13.25 | U1.40 46.19,19.31 v48.75,16.75
  Bottom 0.152: v48.75,16.75 70.25,16.75 v73.75,13.25
VUSB
  Top 1.016: F3.2 60.38,12.94 R13.1
XIN
  Top 0.152: U1.20 39.85,33.17 39.29,33.74 39.29,35.11 38.26,36.14 37.34,36.14 37.13,35.92 37.13,35.24 Y1.3

### Text on the board
SilkscreenTop: GP4_LENS_DET | GP3_B_CS_L | GP0_B_TO_L_TX | GP1_L_TO_B_RX | GP2_L_CS_B | GP6_LOGIC_VCC | GP5_B_VD_L | LOGIC_GND | GP7_LENS_PWR | LENS_GND | GP10 | GP11 | GND | 3V3 | GP8 | GP9 | GP12 | GP13 | GP14 | GP15
SilkscreenBottom: LENS_DET_GP4 | B_CS_L_GP3 | B_TO_L_TX_GP0 | L_TO_B_RX_GP1 | L_CS_B_GP2 | LOGIC_VCC_GP6 | B_VD_L_GP5 | LOGIC_GND | LENS_PWR_GP7 | Rev 1.0 / Nov 2026 | LENS_GND | GP10 | GP11 | GND | 3V3 | GP8 | GP9 | GP12 | GP13 | GP14 | GP15